# Altium schematic sheet Power_Supplies.SchDoc
size A; Author: Jared Ainsworth; CompanyName: UpRev LLC; Engineer: Jared Ainsworth; Organization: UpRev LLC; Address1: 4807 Commercial Park Dr.; Address2: Austin, TX 78724; Address3: United States; Address4: www.UpRev.com; SheetNumber: 9; SheetTotal: 13
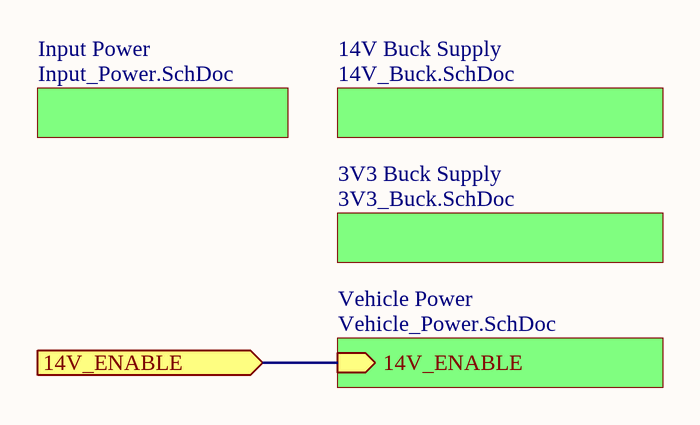
[diagram p0: Power_Supplies.SchDoc]

## Sub-sheets
3V3 Buck Supply = 3V3_Buck.SchDoc: no entries
14V Buck Supply = 14V_Buck.SchDoc: no entries
Input Power = Input_Power.SchDoc: no entries
Vehicle Power = Vehicle_Power.SchDoc: 14V_ENABLE (in)

## Ports
14V_ENABLE (in, see Top_Level[2C], Dev_Board_Connection[2B], Vehicle_Power[1C])

## Nets
14V_ENABLE: port 14V_ENABLE, sheet Vehicle Power/14V_ENABLE

## Notes on the sheet
- Title
- Size:
- Engineer:
- A
- Number:
- Revision:
- Sheet
- of
- File: